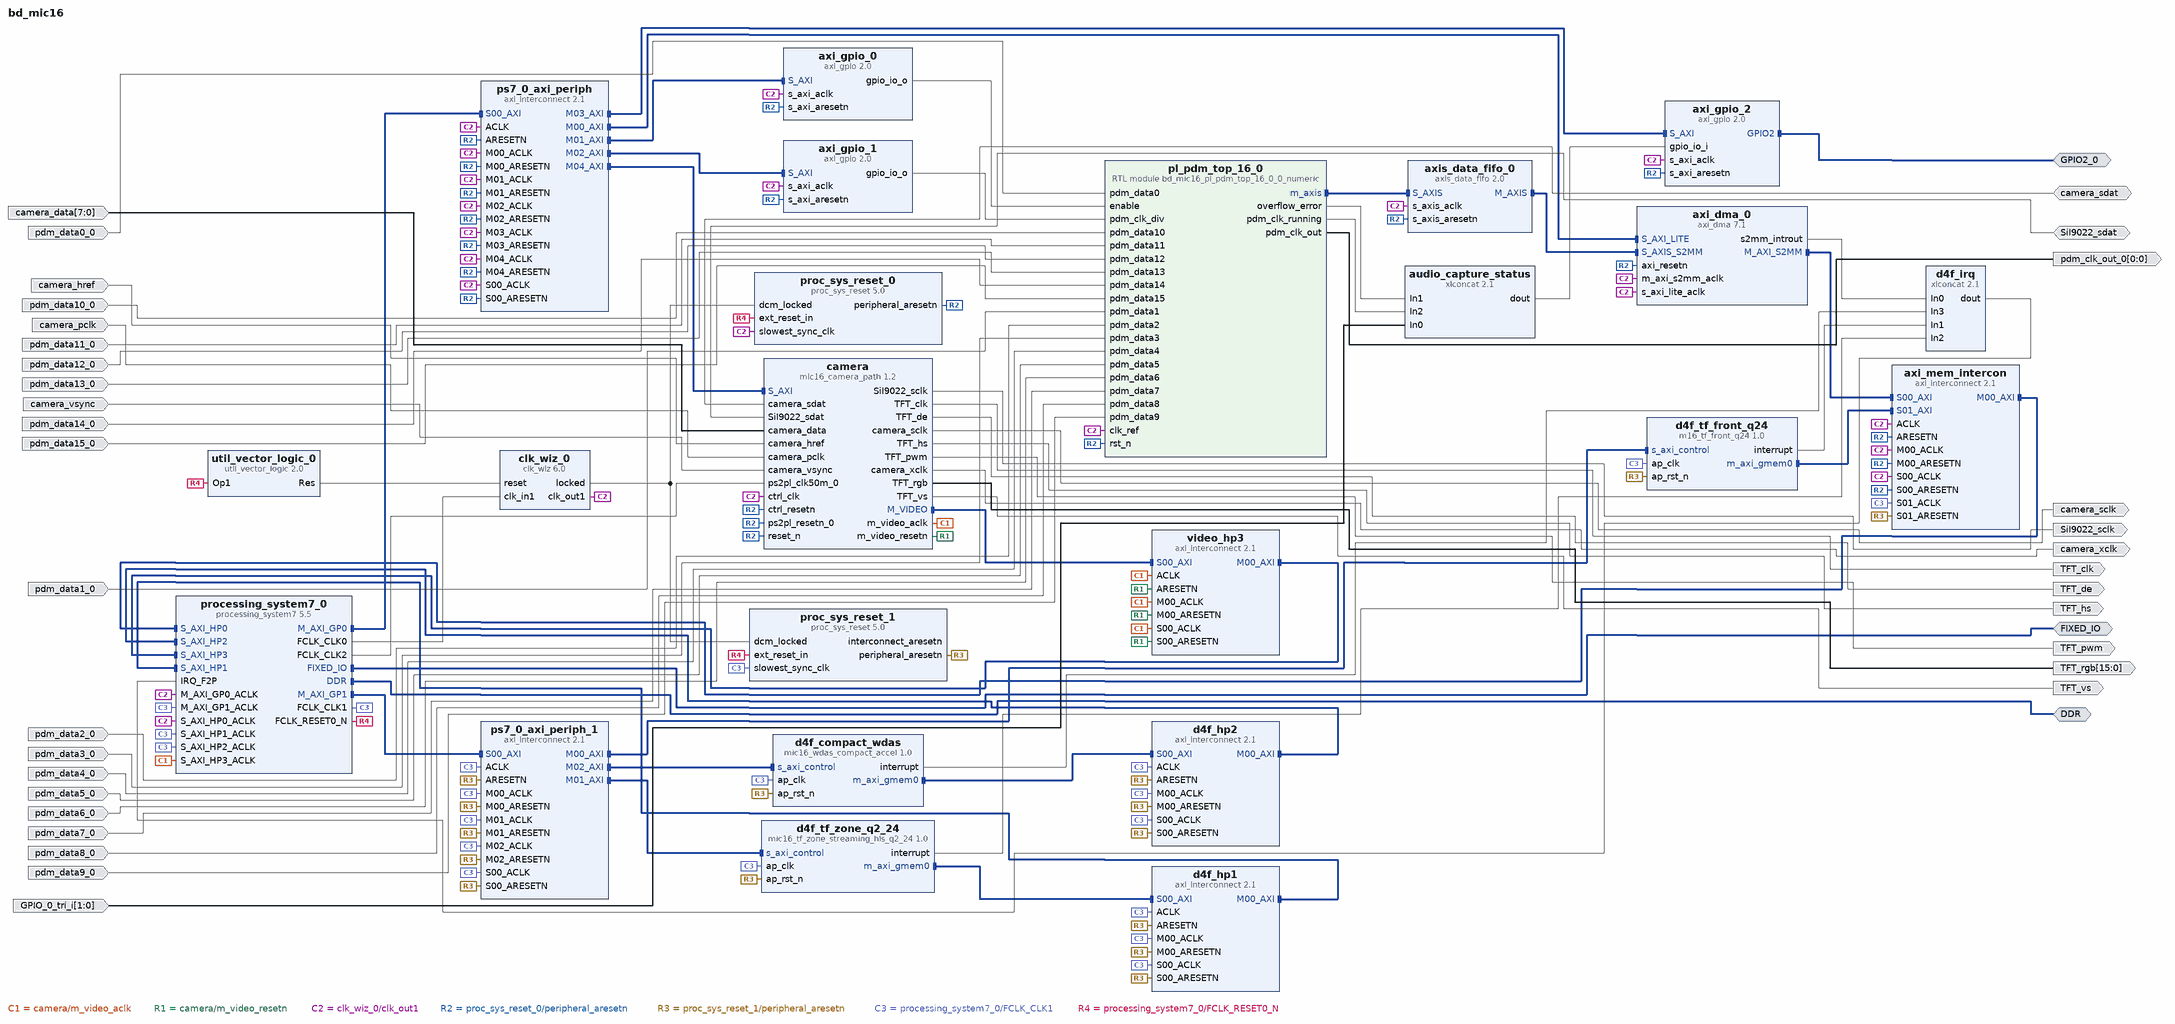
[diagram p0: block diagram of the top level]
# Vivado block design bd_mic16, xc7z020clg484-2, Vivado 2020.2
create_bd_design bd_mic16

create_bd_intf_port -mode Master -vlnv xilinx.com:interface:ddrx_rtl:1.0 DDR
create_bd_intf_port -mode Master -vlnv xilinx.com:display_processing_system7:fixedio_rtl:1.0 FIXED_IO
create_bd_intf_port -mode Master -vlnv xilinx.com:interface:gpio_rtl:1.0 GPIO2_0
create_bd_port -dir O SiI9022_sclk
create_bd_port -dir IO SiI9022_sdat
create_bd_port -dir O -type clk TFT_clk
set_property -dict {CONFIG.FREQ_HZ 32727273} [get_bd_ports TFT_clk]
create_bd_port -dir O TFT_de
create_bd_port -dir O TFT_hs
create_bd_port -dir O TFT_pwm
create_bd_port -dir O -from 15 -to 0 TFT_rgb
create_bd_port -dir O TFT_vs
create_bd_port -dir I -from 7 -to 0 camera_data
create_bd_port -dir I camera_href
create_bd_port -dir I camera_pclk
create_bd_port -dir O camera_sclk
create_bd_port -dir IO camera_sdat
create_bd_port -dir I camera_vsync
create_bd_port -dir O camera_xclk
create_bd_port -dir O -from 0 -to 0 pdm_clk_out_0
create_bd_port -dir I pdm_data0_0
create_bd_port -dir I pdm_data10_0
create_bd_port -dir I pdm_data11_0
create_bd_port -dir I pdm_data12_0
create_bd_port -dir I pdm_data13_0
create_bd_port -dir I pdm_data14_0
create_bd_port -dir I pdm_data15_0
create_bd_port -dir I pdm_data1_0
create_bd_port -dir I pdm_data2_0
create_bd_port -dir I pdm_data3_0
create_bd_port -dir I pdm_data4_0
create_bd_port -dir I pdm_data5_0
create_bd_port -dir I pdm_data6_0
create_bd_port -dir I pdm_data7_0
create_bd_port -dir I pdm_data8_0
create_bd_port -dir I pdm_data9_0
create_bd_port -dir I -from 1 -to 0 GPIO_0_tri_i

create_bd_cell -type ip -vlnv xilinx.com:ip:axi_dma:7.1 axi_dma_0
set_property -dict [list \
  CONFIG.c_include_mm2s 0 \
  CONFIG.c_include_sg 0 \
  CONFIG.c_m_axi_s2mm_data_width 32 \
  CONFIG.c_s_axis_s2mm_tdata_width 32 \
] [get_bd_cells axi_dma_0]
create_bd_cell -type ip -vlnv xilinx.com:ip:axi_gpio:2.0 axi_gpio_0
set_property -dict {CONFIG.C_GPIO_WIDTH 1} [get_bd_cells axi_gpio_0]
create_bd_cell -type ip -vlnv xilinx.com:ip:axi_gpio:2.0 axi_gpio_1
set_property -dict {CONFIG.C_GPIO_WIDTH 16} [get_bd_cells axi_gpio_1]
create_bd_cell -type ip -vlnv xilinx.com:ip:axi_gpio:2.0 axi_gpio_2
set_property -dict [list \
  CONFIG.C_ALL_INPUTS 1 \
  CONFIG.C_ALL_OUTPUTS_2 1 \
  CONFIG.C_GPIO2_WIDTH 3 \
  CONFIG.C_GPIO_WIDTH 4 \
  CONFIG.C_IS_DUAL 1 \
] [get_bd_cells axi_gpio_2]
create_bd_cell -type ip -vlnv xilinx.com:ip:axi_interconnect:2.1 axi_mem_intercon
set_property -dict {CONFIG.NUM_MI 1 CONFIG.NUM_SI 2} [get_bd_cells axi_mem_intercon]
create_bd_cell -type ip -vlnv xilinx.com:ip:axis_data_fifo:2.0 axis_data_fifo_0
set_property -dict [list \
  CONFIG.FIFO_DEPTH 1024 \
  CONFIG.FIFO_MODE 2 \
  CONFIG.HAS_TKEEP 1 \
  CONFIG.TDATA_NUM_BYTES 4 \
] [get_bd_cells axis_data_fifo_0]
create_bd_cell -type ip -vlnv xilinx.com:ip:clk_wiz:6.0 clk_wiz_0
set_property -dict {CONFIG.PRIM_IN_FREQ 100.000} [get_bd_cells clk_wiz_0]
create_bd_cell -type ip -vlnv xilinx.com:hls:mic16_wdas_compact_accel:1.0 d4f_compact_wdas
create_bd_cell -type ip -vlnv xilinx.com:ip:axi_interconnect:2.1 d4f_hp1
set_property -dict {CONFIG.NUM_MI 1 CONFIG.NUM_SI 1} [get_bd_cells d4f_hp1]
create_bd_cell -type ip -vlnv xilinx.com:ip:axi_interconnect:2.1 d4f_hp2
set_property -dict {CONFIG.NUM_MI 1 CONFIG.NUM_SI 1} [get_bd_cells d4f_hp2]
create_bd_cell -type ip -vlnv xilinx.com:ip:xlconcat:2.1 d4f_irq
set_property -dict {CONFIG.NUM_PORTS 4} [get_bd_cells d4f_irq]
create_bd_cell -type ip -vlnv xilinx.com:hls:m16_tf_front_q24:1.0 d4f_tf_front_q24
create_bd_cell -type ip -vlnv xilinx.com:hls:mic16_tf_zone_streaming_hls_q2_24:1.0 d4f_tf_zone_q2_24
create_bd_cell -type module -reference bd_mic16_pl_pdm_top_16_0_0_numeric pl_pdm_top_16_0
create_bd_cell -type ip -vlnv xilinx.com:ip:proc_sys_reset:5.0 proc_sys_reset_0
create_bd_cell -type ip -vlnv xilinx.com:ip:proc_sys_reset:5.0 proc_sys_reset_1
create_bd_cell -type ip -vlnv xilinx.com:ip:processing_system7:5.5 processing_system7_0
set_property -dict [list \
  CONFIG.PCW_APU_PERIPHERAL_FREQMHZ 666.666666 \
  CONFIG.PCW_CPU_CPU_6X4X_MAX_RANGE 767 \
  CONFIG.PCW_ENET0_ENET0_IO {MIO 16 .. 27} \
  CONFIG.PCW_ENET0_GRP_MDIO_ENABLE 1 \
  CONFIG.PCW_ENET0_GRP_MDIO_IO {MIO 52 .. 53} \
  CONFIG.PCW_ENET0_PERIPHERAL_ENABLE 1 \
  CONFIG.PCW_EN_CLK1_PORT 1 \
  CONFIG.PCW_EN_CLK2_PORT 1 \
  CONFIG.PCW_FCLK_CLK1_BUF TRUE \
  CONFIG.PCW_FCLK_CLK2_BUF TRUE \
  CONFIG.PCW_FPGA0_PERIPHERAL_FREQMHZ 100.000000 \
  CONFIG.PCW_FPGA1_PERIPHERAL_FREQMHZ 125.000000 \
  CONFIG.PCW_FPGA_FCLK1_ENABLE 1 \
  CONFIG.PCW_FPGA_FCLK2_ENABLE 1 \
  CONFIG.PCW_GPIO_MIO_GPIO_ENABLE 0 \
  CONFIG.PCW_IRQ_F2P_INTR 1 \
  CONFIG.PCW_PERIPHERAL_BOARD_PRESET None \
  CONFIG.PCW_PRESET_BANK1_VOLTAGE {LVCMOS 1.8V} \
  CONFIG.PCW_QSPI_PERIPHERAL_ENABLE 0 \
  CONFIG.PCW_SD0_PERIPHERAL_ENABLE 0 \
  CONFIG.PCW_UART1_PERIPHERAL_ENABLE 1 \
  CONFIG.PCW_UART1_UART1_IO {MIO 48 .. 49} \
  CONFIG.PCW_UART_PERIPHERAL_FREQMHZ 100 \
  CONFIG.PCW_UIPARAM_DDR_FREQ_MHZ 533.333333 \
  CONFIG.PCW_UIPARAM_DDR_PARTNO {MT41K256M16 RE-125} \
  CONFIG.PCW_USB0_PERIPHERAL_ENABLE 0 \
  CONFIG.PCW_USE_FABRIC_INTERRUPT 1 \
  CONFIG.PCW_USE_M_AXI_GP1 1 \
  CONFIG.PCW_USE_S_AXI_HP0 1 \
  CONFIG.PCW_USE_S_AXI_HP1 1 \
  CONFIG.PCW_USE_S_AXI_HP2 1 \
  CONFIG.PCW_USE_S_AXI_HP3 1 \
  CONFIG.preset None \
] [get_bd_cells processing_system7_0]
# 394 more settings of processing_system7_0 are not shown: defaults, MIO pin electricals, DDR timing, and values the tool derives
create_bd_cell -type ip -vlnv xilinx.com:ip:axi_interconnect:2.1 ps7_0_axi_periph
set_property -dict {CONFIG.NUM_MI 5} [get_bd_cells ps7_0_axi_periph]
create_bd_cell -type ip -vlnv xilinx.com:ip:axi_interconnect:2.1 ps7_0_axi_periph_1
set_property -dict {CONFIG.NUM_MI 3 CONFIG.NUM_SI 1} [get_bd_cells ps7_0_axi_periph_1]
create_bd_cell -type ip -vlnv xilinx.com:ip:util_vector_logic:2.0 util_vector_logic_0
set_property -dict {CONFIG.C_OPERATION not CONFIG.C_SIZE 1} [get_bd_cells util_vector_logic_0]
create_bd_cell -type ip -vlnv xilinx.com:ip:axi_interconnect:2.1 video_hp3
set_property -dict {CONFIG.NUM_MI 1 CONFIG.NUM_SI 1} [get_bd_cells video_hp3]
create_bd_cell -type ip -vlnv mic16.local:av:mic16_camera_path:1.2 camera
create_bd_cell -type ip -vlnv xilinx.com:ip:xlconcat:2.1 audio_capture_status
set_property -dict [list \
  CONFIG.IN0_WIDTH 2 \
  CONFIG.IN1_WIDTH 1 \
  CONFIG.IN2_WIDTH 1 \
  CONFIG.NUM_PORTS 3 \
] [get_bd_cells audio_capture_status]

# ---- connections ----

connect_bd_intf_net [get_bd_intf_pins axi_mem_intercon/M00_AXI] [get_bd_intf_pins processing_system7_0/S_AXI_HP0]
connect_bd_intf_net [get_bd_intf_pins axis_data_fifo_0/S_AXIS] [get_bd_intf_pins pl_pdm_top_16_0/m_axis]
connect_bd_intf_net [get_bd_intf_pins d4f_compact_wdas/m_axi_gmem0] [get_bd_intf_pins d4f_hp2/S00_AXI]
connect_bd_intf_net [get_bd_intf_pins axi_dma_0/S_AXI_LITE] [get_bd_intf_pins ps7_0_axi_periph/M00_AXI]
connect_bd_intf_net [get_bd_intf_pins camera/M_VIDEO] [get_bd_intf_pins video_hp3/S00_AXI]
connect_bd_intf_net [get_bd_intf_pins d4f_hp2/M00_AXI] [get_bd_intf_pins processing_system7_0/S_AXI_HP2]
connect_bd_intf_net [get_bd_intf_pins axi_dma_0/M_AXI_S2MM] [get_bd_intf_pins axi_mem_intercon/S00_AXI]
connect_bd_intf_net [get_bd_intf_pins axi_dma_0/S_AXIS_S2MM] [get_bd_intf_pins axis_data_fifo_0/M_AXIS]
connect_bd_intf_net [get_bd_intf_pins d4f_tf_zone_q2_24/s_axi_control] [get_bd_intf_pins ps7_0_axi_periph_1/M01_AXI]
connect_bd_intf_net [get_bd_intf_pins d4f_compact_wdas/s_axi_control] [get_bd_intf_pins ps7_0_axi_periph_1/M02_AXI]
connect_bd_intf_net [get_bd_intf_pins processing_system7_0/S_AXI_HP3] [get_bd_intf_pins video_hp3/M00_AXI]
connect_bd_intf_net [get_bd_intf_ports FIXED_IO] [get_bd_intf_pins processing_system7_0/FIXED_IO]
connect_bd_intf_net [get_bd_intf_ports DDR] [get_bd_intf_pins processing_system7_0/DDR]
connect_bd_intf_net [get_bd_intf_pins processing_system7_0/M_AXI_GP0] [get_bd_intf_pins ps7_0_axi_periph/S00_AXI]
connect_bd_intf_net [get_bd_intf_pins axi_gpio_0/S_AXI] [get_bd_intf_pins ps7_0_axi_periph/M01_AXI]
connect_bd_intf_net [get_bd_intf_pins d4f_hp1/S00_AXI] [get_bd_intf_pins d4f_tf_zone_q2_24/m_axi_gmem0]
connect_bd_intf_net [get_bd_intf_pins axi_mem_intercon/S01_AXI] [get_bd_intf_pins d4f_tf_front_q24/m_axi_gmem0]
connect_bd_intf_net [get_bd_intf_pins camera/S_AXI] [get_bd_intf_pins ps7_0_axi_periph/M04_AXI]
connect_bd_intf_net [get_bd_intf_pins axi_gpio_1/S_AXI] [get_bd_intf_pins ps7_0_axi_periph/M02_AXI]
connect_bd_intf_net [get_bd_intf_pins d4f_hp1/M00_AXI] [get_bd_intf_pins processing_system7_0/S_AXI_HP1]
connect_bd_intf_net [get_bd_intf_pins processing_system7_0/M_AXI_GP1] [get_bd_intf_pins ps7_0_axi_periph_1/S00_AXI]
connect_bd_intf_net [get_bd_intf_ports GPIO2_0] [get_bd_intf_pins axi_gpio_2/GPIO2]
connect_bd_intf_net [get_bd_intf_pins axi_gpio_2/S_AXI] [get_bd_intf_pins ps7_0_axi_periph/M03_AXI]
connect_bd_intf_net [get_bd_intf_pins d4f_tf_front_q24/s_axi_control] [get_bd_intf_pins ps7_0_axi_periph_1/M00_AXI]
# net ARESETN_1 has one end: proc_sys_reset_1/interconnect_aresetn
connect_bd_net [get_bd_ports camera_sdat] [get_bd_pins camera/camera_sdat]
connect_bd_net [get_bd_ports SiI9022_sdat] [get_bd_pins camera/SiI9022_sdat]
connect_bd_net [get_bd_pins axi_dma_0/s2mm_introut] [get_bd_pins d4f_irq/In0]
connect_bd_net [get_bd_pins axi_gpio_0/gpio_io_o] [get_bd_pins pl_pdm_top_16_0/enable]
connect_bd_net [get_bd_pins axi_gpio_1/gpio_io_o] [get_bd_pins pl_pdm_top_16_0/pdm_clk_div]
connect_bd_net [get_bd_pins camera/SiI9022_sclk] [get_bd_ports SiI9022_sclk]
connect_bd_net [get_bd_pins camera/TFT_clk] [get_bd_ports TFT_clk]
connect_bd_net [get_bd_pins camera/TFT_de] [get_bd_ports TFT_de]
connect_bd_net [get_bd_pins camera/TFT_hs] [get_bd_ports TFT_hs]
connect_bd_net [get_bd_pins camera/TFT_pwm] [get_bd_ports TFT_pwm]
connect_bd_net [get_bd_pins camera/TFT_rgb] [get_bd_ports TFT_rgb]
connect_bd_net [get_bd_pins camera/TFT_vs] [get_bd_ports TFT_vs]
connect_bd_net [get_bd_pins camera/camera_sclk] [get_bd_ports camera_sclk]
connect_bd_net [get_bd_pins camera/camera_xclk] [get_bd_ports camera_xclk]
connect_bd_net -net camera_data_0_1 [get_bd_ports camera_data] [get_bd_pins camera/camera_data]
connect_bd_net -net camera_href_0_1 [get_bd_ports camera_href] [get_bd_pins camera/camera_href]
connect_bd_net [get_bd_pins camera/m_video_aclk] \
  [get_bd_pins processing_system7_0/S_AXI_HP3_ACLK] [get_bd_pins video_hp3/ACLK] [get_bd_pins video_hp3/M00_ACLK] \
  [get_bd_pins video_hp3/S00_ACLK]
connect_bd_net [get_bd_pins camera/m_video_resetn] \
  [get_bd_pins video_hp3/ARESETN] [get_bd_pins video_hp3/M00_ARESETN] [get_bd_pins video_hp3/S00_ARESETN]
connect_bd_net -net camera_pclk_0_1 [get_bd_ports camera_pclk] [get_bd_pins camera/camera_pclk]
connect_bd_net -net camera_vsync_0_1 [get_bd_ports camera_vsync] [get_bd_pins camera/camera_vsync]
connect_bd_net [get_bd_pins clk_wiz_0/clk_out1] \
  [get_bd_pins axi_dma_0/m_axi_s2mm_aclk] [get_bd_pins axi_dma_0/s_axi_lite_aclk] [get_bd_pins axi_gpio_0/s_axi_aclk] \
  [get_bd_pins axi_gpio_1/s_axi_aclk] [get_bd_pins axi_gpio_2/s_axi_aclk] [get_bd_pins axi_mem_intercon/ACLK] \
  [get_bd_pins axi_mem_intercon/M00_ACLK] [get_bd_pins axi_mem_intercon/S00_ACLK] [get_bd_pins axis_data_fifo_0/s_axis_aclk] \
  [get_bd_pins pl_pdm_top_16_0/clk_ref] [get_bd_pins proc_sys_reset_0/slowest_sync_clk] \
  [get_bd_pins processing_system7_0/M_AXI_GP0_ACLK] [get_bd_pins processing_system7_0/S_AXI_HP0_ACLK] \
  [get_bd_pins ps7_0_axi_periph/ACLK] [get_bd_pins ps7_0_axi_periph/M00_ACLK] [get_bd_pins ps7_0_axi_periph/M01_ACLK] \
  [get_bd_pins ps7_0_axi_periph/M02_ACLK] [get_bd_pins ps7_0_axi_periph/M03_ACLK] [get_bd_pins ps7_0_axi_periph/M04_ACLK] \
  [get_bd_pins ps7_0_axi_periph/S00_ACLK] [get_bd_pins camera/ctrl_clk]
connect_bd_net [get_bd_pins clk_wiz_0/locked] [get_bd_pins proc_sys_reset_0/dcm_locked] [get_bd_pins proc_sys_reset_1/dcm_locked]
connect_bd_net [get_bd_pins d4f_compact_wdas/interrupt] [get_bd_pins d4f_irq/In3]
connect_bd_net [get_bd_pins d4f_irq/dout] [get_bd_pins processing_system7_0/IRQ_F2P]
connect_bd_net [get_bd_pins d4f_tf_front_q24/interrupt] [get_bd_pins d4f_irq/In1]
connect_bd_net [get_bd_pins d4f_tf_zone_q2_24/interrupt] [get_bd_pins d4f_irq/In2]
connect_bd_net -net pdm_data0_0_1 [get_bd_ports pdm_data0_0] [get_bd_pins pl_pdm_top_16_0/pdm_data0]
connect_bd_net -net pdm_data10_0_1 [get_bd_ports pdm_data10_0] [get_bd_pins pl_pdm_top_16_0/pdm_data10]
connect_bd_net -net pdm_data11_0_1 [get_bd_ports pdm_data11_0] [get_bd_pins pl_pdm_top_16_0/pdm_data11]
connect_bd_net -net pdm_data12_0_1 [get_bd_ports pdm_data12_0] [get_bd_pins pl_pdm_top_16_0/pdm_data12]
connect_bd_net -net pdm_data13_0_1 [get_bd_ports pdm_data13_0] [get_bd_pins pl_pdm_top_16_0/pdm_data13]
connect_bd_net -net pdm_data14_0_1 [get_bd_ports pdm_data14_0] [get_bd_pins pl_pdm_top_16_0/pdm_data14]
connect_bd_net -net pdm_data15_0_1 [get_bd_ports pdm_data15_0] [get_bd_pins pl_pdm_top_16_0/pdm_data15]
connect_bd_net -net pdm_data1_0_1 [get_bd_ports pdm_data1_0] [get_bd_pins pl_pdm_top_16_0/pdm_data1]
connect_bd_net -net pdm_data2_0_1 [get_bd_ports pdm_data2_0] [get_bd_pins pl_pdm_top_16_0/pdm_data2]
connect_bd_net -net pdm_data3_0_1 [get_bd_ports pdm_data3_0] [get_bd_pins pl_pdm_top_16_0/pdm_data3]
connect_bd_net -net pdm_data4_0_1 [get_bd_ports pdm_data4_0] [get_bd_pins pl_pdm_top_16_0/pdm_data4]
connect_bd_net -net pdm_data5_0_1 [get_bd_ports pdm_data5_0] [get_bd_pins pl_pdm_top_16_0/pdm_data5]
connect_bd_net -net pdm_data6_0_1 [get_bd_ports pdm_data6_0] [get_bd_pins pl_pdm_top_16_0/pdm_data6]
connect_bd_net -net pdm_data7_0_1 [get_bd_ports pdm_data7_0] [get_bd_pins pl_pdm_top_16_0/pdm_data7]
connect_bd_net -net pdm_data8_0_1 [get_bd_ports pdm_data8_0] [get_bd_pins pl_pdm_top_16_0/pdm_data8]
connect_bd_net -net pdm_data9_0_1 [get_bd_ports pdm_data9_0] [get_bd_pins pl_pdm_top_16_0/pdm_data9]
connect_bd_net [get_bd_pins pl_pdm_top_16_0/pdm_clk_out] [get_bd_ports pdm_clk_out_0]
connect_bd_net [get_bd_pins proc_sys_reset_0/peripheral_aresetn] \
  [get_bd_pins axi_dma_0/axi_resetn] [get_bd_pins axi_gpio_0/s_axi_aresetn] [get_bd_pins axi_gpio_1/s_axi_aresetn] \
  [get_bd_pins axi_gpio_2/s_axi_aresetn] [get_bd_pins axi_mem_intercon/ARESETN] [get_bd_pins axi_mem_intercon/M00_ARESETN] \
  [get_bd_pins axi_mem_intercon/S00_ARESETN] [get_bd_pins axis_data_fifo_0/s_axis_aresetn] \
  [get_bd_pins pl_pdm_top_16_0/rst_n] [get_bd_pins ps7_0_axi_periph/ARESETN] [get_bd_pins ps7_0_axi_periph/M00_ARESETN] \
  [get_bd_pins ps7_0_axi_periph/M01_ARESETN] [get_bd_pins ps7_0_axi_periph/M02_ARESETN] \
  [get_bd_pins ps7_0_axi_periph/M03_ARESETN] [get_bd_pins ps7_0_axi_periph/M04_ARESETN] \
  [get_bd_pins ps7_0_axi_periph/S00_ARESETN] [get_bd_pins camera/reset_n] [get_bd_pins camera/ps2pl_resetn_0] \
  [get_bd_pins camera/ctrl_resetn]
connect_bd_net [get_bd_pins proc_sys_reset_1/peripheral_aresetn] \
  [get_bd_pins axi_mem_intercon/S01_ARESETN] [get_bd_pins d4f_compact_wdas/ap_rst_n] [get_bd_pins d4f_hp1/ARESETN] \
  [get_bd_pins d4f_hp1/M00_ARESETN] [get_bd_pins d4f_hp1/S00_ARESETN] [get_bd_pins d4f_hp2/ARESETN] \
  [get_bd_pins d4f_hp2/M00_ARESETN] [get_bd_pins d4f_hp2/S00_ARESETN] [get_bd_pins d4f_tf_front_q24/ap_rst_n] \
  [get_bd_pins d4f_tf_zone_q2_24/ap_rst_n] [get_bd_pins ps7_0_axi_periph_1/ARESETN] \
  [get_bd_pins ps7_0_axi_periph_1/M00_ARESETN] [get_bd_pins ps7_0_axi_periph_1/M01_ARESETN] \
  [get_bd_pins ps7_0_axi_periph_1/M02_ARESETN] [get_bd_pins ps7_0_axi_periph_1/S00_ARESETN]
connect_bd_net [get_bd_pins processing_system7_0/FCLK_CLK0] [get_bd_pins clk_wiz_0/clk_in1]
connect_bd_net [get_bd_pins processing_system7_0/FCLK_CLK1] \
  [get_bd_pins axi_mem_intercon/S01_ACLK] [get_bd_pins d4f_compact_wdas/ap_clk] [get_bd_pins d4f_hp1/ACLK] \
  [get_bd_pins d4f_hp1/M00_ACLK] [get_bd_pins d4f_hp1/S00_ACLK] [get_bd_pins d4f_hp2/ACLK] [get_bd_pins d4f_hp2/M00_ACLK] \
  [get_bd_pins d4f_hp2/S00_ACLK] [get_bd_pins d4f_tf_front_q24/ap_clk] [get_bd_pins d4f_tf_zone_q2_24/ap_clk] \
  [get_bd_pins proc_sys_reset_1/slowest_sync_clk] [get_bd_pins processing_system7_0/M_AXI_GP1_ACLK] \
  [get_bd_pins processing_system7_0/S_AXI_HP1_ACLK] [get_bd_pins processing_system7_0/S_AXI_HP2_ACLK] \
  [get_bd_pins ps7_0_axi_periph_1/ACLK] [get_bd_pins ps7_0_axi_periph_1/M00_ACLK] [get_bd_pins ps7_0_axi_periph_1/M01_ACLK] \
  [get_bd_pins ps7_0_axi_periph_1/M02_ACLK] [get_bd_pins ps7_0_axi_periph_1/S00_ACLK]
connect_bd_net [get_bd_pins processing_system7_0/FCLK_CLK2] [get_bd_pins camera/ps2pl_clk50m_0]
connect_bd_net [get_bd_pins processing_system7_0/FCLK_RESET0_N] \
  [get_bd_pins proc_sys_reset_0/ext_reset_in] [get_bd_pins proc_sys_reset_1/ext_reset_in] \
  [get_bd_pins util_vector_logic_0/Op1]
connect_bd_net [get_bd_pins util_vector_logic_0/Res] [get_bd_pins clk_wiz_0/reset]
connect_bd_net [get_bd_ports GPIO_0_tri_i] [get_bd_pins audio_capture_status/In0]
connect_bd_net [get_bd_pins pl_pdm_top_16_0/overflow_error] [get_bd_pins audio_capture_status/In1]
connect_bd_net [get_bd_pins pl_pdm_top_16_0/pdm_clk_running] [get_bd_pins audio_capture_status/In2]
connect_bd_net [get_bd_pins audio_capture_status/dout] [get_bd_pins axi_gpio_2/gpio_io_i]

# ---- address map ----
assign_bd_address -offset 0x00000000 -range 1G -target_address_space [get_bd_addr_spaces axi_dma_0/Data_S2MM] [get_bd_addr_segs processing_system7_0/S_AXI_HP0/HP0_DDR_LOWOCM]
assign_bd_address -offset 0x00000000 -range 1G -target_address_space [get_bd_addr_spaces camera/M_VIDEO] [get_bd_addr_segs processing_system7_0/S_AXI_HP3/HP3_DDR_LOWOCM]
assign_bd_address -offset 0x0000000000000000 -range 1G -target_address_space [get_bd_addr_spaces d4f_compact_wdas/Data_m_axi_gmem0] [get_bd_addr_segs processing_system7_0/S_AXI_HP2/HP2_DDR_LOWOCM]
assign_bd_address -offset 0x0000000000000000 -range 1G -target_address_space [get_bd_addr_spaces d4f_tf_front_q24/Data_m_axi_gmem0] [get_bd_addr_segs processing_system7_0/S_AXI_HP0/HP0_DDR_LOWOCM]
assign_bd_address -offset 0x0000000000000000 -range 1G -target_address_space [get_bd_addr_spaces d4f_tf_zone_q2_24/Data_m_axi_gmem0] [get_bd_addr_segs processing_system7_0/S_AXI_HP1/HP1_DDR_LOWOCM]
assign_bd_address -offset 0x40400000 -range 64K -target_address_space [get_bd_addr_spaces processing_system7_0/Data] [get_bd_addr_segs axi_dma_0/S_AXI_LITE/Reg]
assign_bd_address -offset 0x41200000 -range 64K -target_address_space [get_bd_addr_spaces processing_system7_0/Data] [get_bd_addr_segs axi_gpio_0/S_AXI/Reg]
assign_bd_address -offset 0x41210000 -range 64K -target_address_space [get_bd_addr_spaces processing_system7_0/Data] [get_bd_addr_segs axi_gpio_1/S_AXI/Reg]
assign_bd_address -offset 0x41220000 -range 64K -target_address_space [get_bd_addr_spaces processing_system7_0/Data] [get_bd_addr_segs axi_gpio_2/S_AXI/Reg]
assign_bd_address -offset 0x43C30000 -range 64K -target_address_space [get_bd_addr_spaces processing_system7_0/Data] [get_bd_addr_segs camera/S_AXI/Reg]
assign_bd_address -offset 0x80000000 -range 64K -target_address_space [get_bd_addr_spaces processing_system7_0/Data] [get_bd_addr_segs d4f_tf_front_q24/s_axi_control/Reg]
assign_bd_address -offset 0x80010000 -range 64K -target_address_space [get_bd_addr_spaces processing_system7_0/Data] [get_bd_addr_segs d4f_tf_zone_q2_24/s_axi_control/Reg]
assign_bd_address -offset 0x80020000 -range 64K -target_address_space [get_bd_addr_spaces processing_system7_0/Data] [get_bd_addr_segs d4f_compact_wdas/s_axi_control/Reg]

validate_bd_design
save_bd_design
